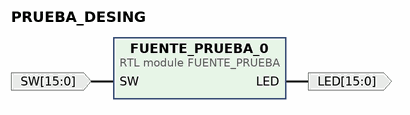
[diagram p0: block diagram of the top level]
# Vivado block design PRUEBA_DESING, xc7a100tcsg324-1, Vivado 2017.4.1
create_bd_design PRUEBA_DESING

create_bd_port -dir O -from 15 -to 0 LED
create_bd_port -dir I -from 15 -to 0 SW

create_bd_cell -type module -reference FUENTE_PRUEBA FUENTE_PRUEBA_0

# ---- connections ----

connect_bd_net [get_bd_pins FUENTE_PRUEBA_0/LED] [get_bd_ports LED]
connect_bd_net -net SW_0_1 [get_bd_ports SW] [get_bd_pins FUENTE_PRUEBA_0/SW]

validate_bd_design
save_bd_design
